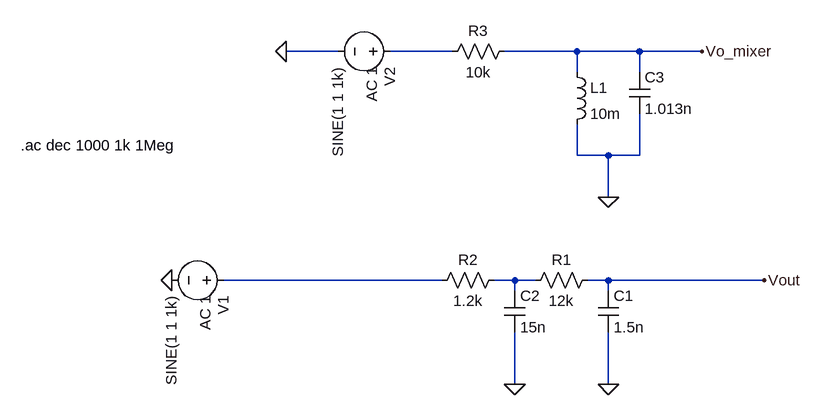
[diagram p0: schematic filtros_teste.asc]
filtros_teste.asc, the LTspice schematic file:
Version 4.1
SHEET 1 880 680
WIRE -160 -288 -240 -288
WIRE 16 -288 -80 -288
WIRE 208 -288 96 -288
WIRE 304 -288 208 -288
WIRE 400 -288 304 -288
WIRE 208 -256 208 -288
WIRE 304 -256 304 -288
WIRE 208 -128 208 -176
WIRE 256 -128 208 -128
WIRE 304 -128 304 -192
WIRE 304 -128 256 -128
WIRE 256 -64 256 -128
WIRE 0 64 -336 64
WIRE 112 64 80 64
WIRE 144 64 112 64
WIRE 256 64 224 64
WIRE 496 64 256 64
WIRE 112 80 112 64
WIRE 256 80 256 64
WIRE 112 224 112 144
WIRE 256 224 256 144
FLAG 256 224 0
FLAG 112 224 0
FLAG 496 64 Vout
FLAG -416 64 0
FLAG 400 -288 Vo_mixer
FLAG 256 -64 0
FLAG -240 -288 0
SYMBOL cap 240 80 R0
SYMATTR InstName C1
SYMATTR Value 1.5n
SYMBOL cap 96 80 R0
SYMATTR InstName C2
SYMATTR Value 15n
SYMBOL res 240 48 R90
WINDOW 0 0 56 VBottom 2
WINDOW 3 32 56 VTop 2
SYMATTR InstName R1
SYMATTR Value 12k
SYMBOL res 96 48 R90
WINDOW 0 0 56 VBottom 2
WINDOW 3 32 56 VTop 2
SYMATTR InstName R2
SYMATTR Value 1.2k
SYMBOL voltage -320 64 R90
WINDOW 123 24 44 Left 2
WINDOW 39 0 0 Left 0
SYMATTR Value2 AC 1
SYMATTR InstName V1
SYMATTR Value SINE(1 1 1k)
SYMBOL res 112 -304 R90
WINDOW 0 0 56 VBottom 2
WINDOW 3 32 56 VTop 2
SYMATTR InstName R3
SYMATTR Value 10k
SYMBOL ind 192 -272 R0
SYMATTR InstName L1
SYMATTR Value 10m
SYMBOL cap 288 -256 R0
SYMATTR InstName C3
SYMATTR Value 1.013n
SYMBOL voltage -64 -288 R90
WINDOW 123 24 44 Left 2
WINDOW 39 0 0 Left 0
SYMATTR Value2 AC 1
SYMATTR InstName V2
SYMATTR Value SINE(1 1 1k)
TEXT -648 -144 Left 2 !.ac dec 1000 1k 1Meg

The netlist it stands for:
* filtros_teste.asc
C1 Vout 0 1.5n
C2 N003 0 15n
R1 Vout N003 12k
R2 N003 N002 1.2k
V1 N002 0 SINE(1 1 1k) AC 1
R3 Vo_mixer N001 10k
L1 Vo_mixer 0 10m
C3 Vo_mixer 0 1.013n
V2 N001 0 SINE(1 1 1k) AC 1
.ac dec 1000 1k 1Meg
.backanno
.end